# EAGLE schematic Bluetooth Test Arduino nano + HC05 (EAGLE 7.7.0)
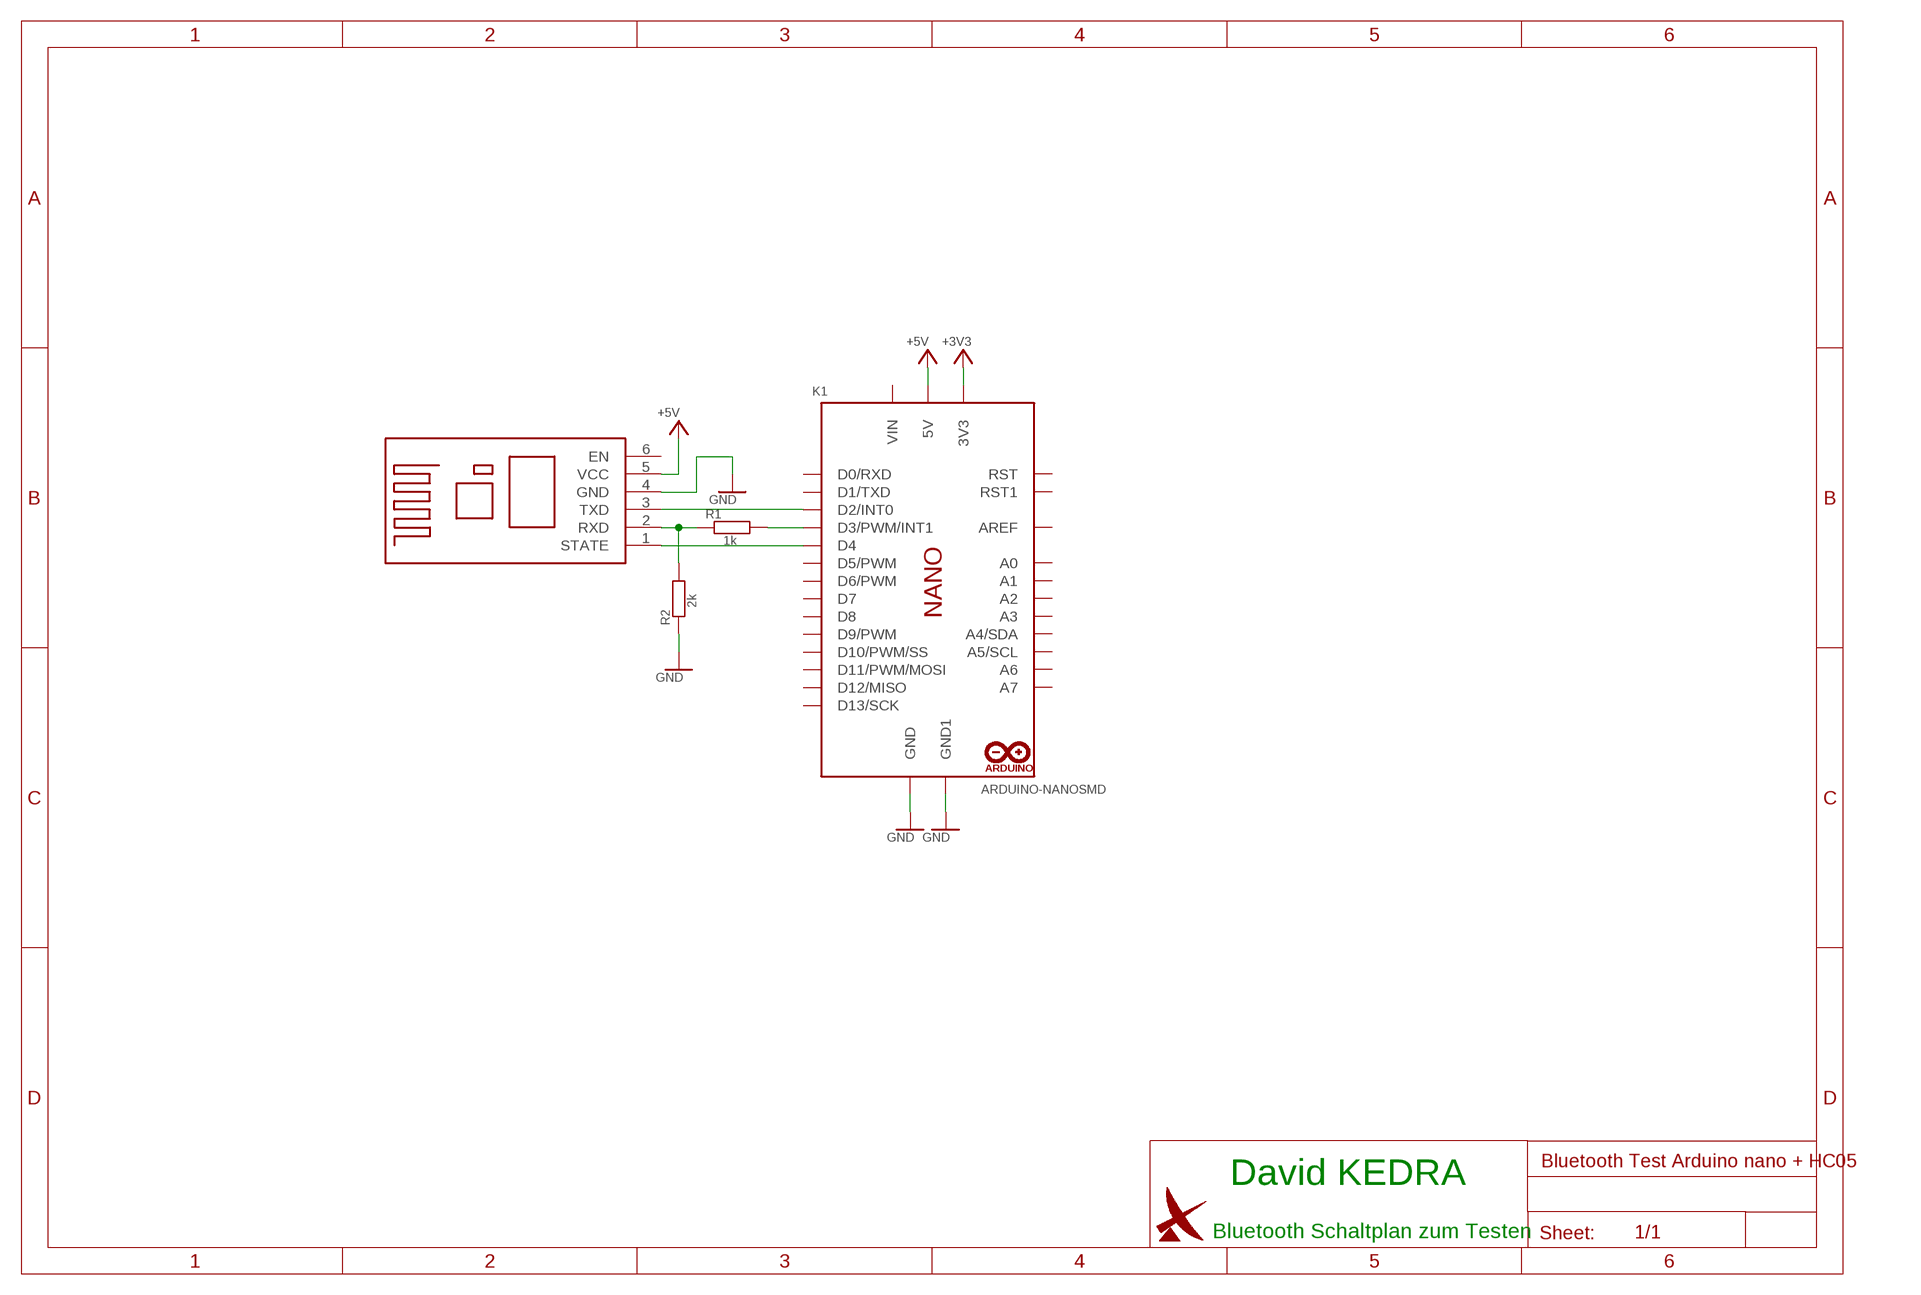
[diagram p0: schematic, sheet 1]

## Parts
B1  BT-05  [BT-05]
K1  ARDUINO-NANOSMD  [ARDUINO-NANO-SMD]
R1  1k  R207-RM10  [207-RM10]
R2  2k  R207-RM10  [207-RM10]

## Nets
+3V3: K1.P$17(3V3)
+5V: B1.5(VCC) K1.P$27(5V)
GND: B1.4(GND) K1.P$4(GND) K1.P$29(GND1) R2.P$1
N$1: B1.3(TXD) K1.P$5(D2/INT0)
N$2: B1.2(RXD) R1.P$1 R2.P$2
N$3: B1.1(STATE) K1.P$7(D4)
N$4: K1.P$6(D3/PWM/INT1) R1.P$2
Unconnected: B1.6(EN) K1.P$1(D1/TXD) K1.P$2(D0/RXD) K1.P$3(RST) K1.P$8(D5/PWM) K1.P$9(D6/PWM) K1.P$10(D7) K1.P$11(D8) K1.P$12(D9/PWM) K1.P$13(D10/PWM/SS) K1.P$14(D11/PWM/MOSI) K1.P$15(D12/MISO) K1.P$16(D13/SCK) K1.P$18(AREF) K1.P$19(A0) K1.P$20(A1) K1.P$21(A2) K1.P$22(A3) K1.P$23(A4/SDA) K1.P$24(A5/SCL) K1.P$25(A6) K1.P$26(A7) K1.P$28(RST1)

## Notes on the sheet
- David KEDRA
- Bluetooth Schaltplan zum Testen

## Power pins joined to a net without a drawn wire
VIN: K1.P$30(VIN)

## Library data of the parts
B1 = bluetooth:BT-05: HC-05 Master & Slave Bluetooth Modul Operating Voltage: 5V Logic Voltage: 3.3V
K1 = HTL22_basis:ARDUINO-NANO: Arduino NANO Ausführung in DIL30 SO30 DIL30 Reverse SO30 Reverse Erstellt: 08.11.18 von neca@htl-donaustadt.at
R1 R2 = HTL22_basis:R: Widerstand Ohmsche Widerstände nach den gültigen Normen : IEC 60617 und EN 81346-2 Folgende Baugrößen sind enthalten: 204 Rastermaß 5mm 204 Rastermaß 7,5mm 204 Rastermaß 10mm 207 Rastermaß 10mm 207 Rastermaß 12mm 207 Rastermaß 15mm 309 Rastermaß 10mm 309 Rastermaß 15mm SMD: 0805 und 1206 Datum: 02.09.2018 erstellt von: neca@htl-donaustadt.at